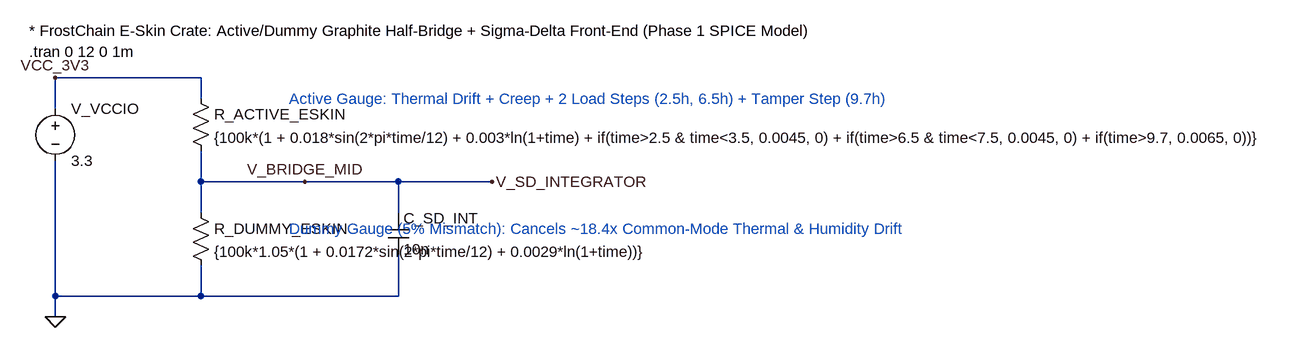
[diagram p0: schematic FrostChain_ESkin_SigmaDelta.asc]
FrostChain_ESkin_SigmaDelta.asc, the LTspice schematic file:
Version 4
SHEET 1 1400 800
WIRE 160 128 160 176
WIRE 160 256 160 304
WIRE 160 128 384 128
WIRE 384 128 384 160
WIRE 384 240 384 288
WIRE 384 288 544 288
WIRE 384 288 384 336
WIRE 384 416 384 464
WIRE 160 464 384 464
WIRE 160 304 160 464
WIRE 160 464 160 496
WIRE 544 288 688 288
WIRE 688 288 688 336
WIRE 688 400 688 464
WIRE 384 464 688 464
WIRE 688 288 832 288
FLAG 160 496 0
FLAG 160 128 VCC_3V3
FLAG 544 288 V_BRIDGE_MID
FLAG 832 288 V_SD_INTEGRATOR
SYMBOL voltage 160 160 R0
WINDOW 123 0 0 Left 0
WINDOW 39 0 0 Left 0
SYMATTR InstName V_VCCIO
SYMATTR Value 3.3
SYMBOL res 368 144 R0
SYMATTR InstName R_ACTIVE_ESKIN
SYMATTR Value {100k*(1 + 0.018*sin(2*pi*time/12) + 0.003*ln(1+time) + if(time>2.5 & time<3.5, 0.0045, 0) + if(time>6.5 & time<7.5, 0.0045, 0) + if(time>9.7, 0.0065, 0))}
SYMBOL res 368 320 R0
SYMATTR InstName R_DUMMY_ESKIN
SYMATTR Value {100k*1.05*(1 + 0.0172*sin(2*pi*time/12) + 0.0029*ln(1+time))}
SYMBOL cap 672 336 R0
SYMATTR InstName C_SD_INT
SYMATTR Value 10n
TEXT 120 56 Left 2 !* FrostChain E-Skin Crate: Active/Dummy Graphite Half-Bridge + Sigma-Delta Front-End (Phase 1 SPICE Model)
TEXT 120 88 Left 2 !.tran 0 12 0 1m
TEXT 520 160 Left 2 ;Active Gauge: Thermal Drift + Creep + 2 Load Steps (2.5h, 6.5h) + Tamper Step (9.7h)
TEXT 520 360 Left 2 ;Dummy Gauge (5% Mismatch): Cancels ~18.4x Common-Mode Thermal & Humidity Drift

The netlist it stands for:
* FrostChain_ESkin_SigmaDelta.asc
V_VCCIO VCC_3V3 0 3.3
R_ACTIVE_ESKIN VCC_3V3 V_SD_INTEGRATOR {100k*(1 + 0.018*sin(2*pi*time/12) + 0.003*ln(1+time) + if(time>2.5 & time<3.5, 0.0045, 0) + if(time>6.5 & time<7.5, 0.0045, 0) + if(time>9.7, 0.0065, 0))}
R_DUMMY_ESKIN V_SD_INTEGRATOR 0 {100k*1.05*(1 + 0.0172*sin(2*pi*time/12) + 0.0029*ln(1+time))}
C_SD_INT V_SD_INTEGRATOR 0 10n
* FrostChain E-Skin Crate: Active/Dummy Graphite Half-Bridge + Sigma-Delta Front-End (Phase 1 SPICE Model)
.tran 0 12 0 1m
* Active Gauge: Thermal Drift + Creep + 2 Load Steps (2.5h, 6.5h) + Tamper Step (9.7h)
* Dummy Gauge (5% Mismatch): Cancels ~18.4x Common-Mode Thermal & Humidity Drift
.backanno
.end